# EasyEDA Pro project realtix-sakura_nfc-d968f2f9.epro, schematic Schematic4
Board Name: 执行器; Create Date: 2025-03-24; Page Name: P1; Project Name: 小樱nfc鸟头杖; Schematic Name: Schematic4; Update Date: 2025-03-24; Company: 嘉立创EDA; Page Size: A5; Version: V1.0
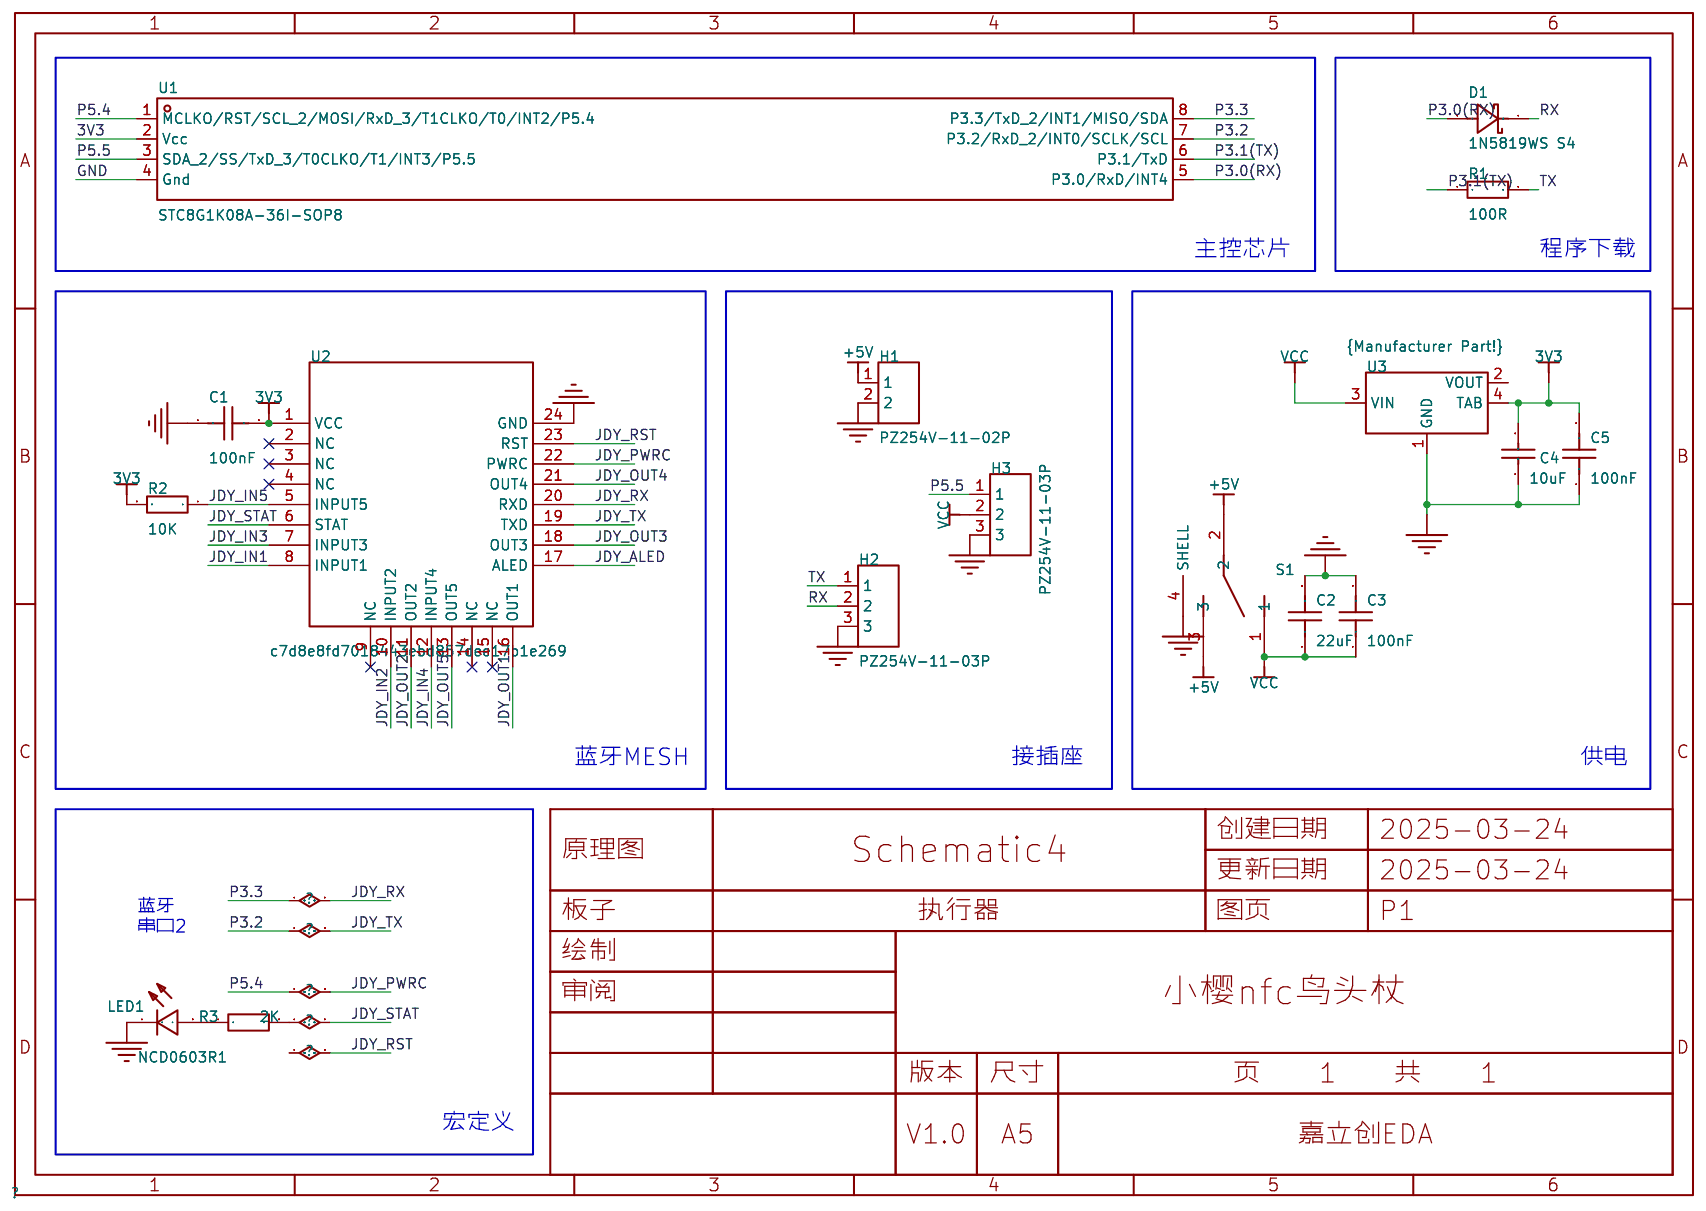
[diagram p3: schematic sheet]

## Parts
C1  100nF  [C0603]
C2  22uF  [C0805]
C3  100nF  [C0603]
C4  10uF  [C0805]
C5  100nF  [C0603]
D1  1N5819WS S4  [SOD-323_L1.6-W1.3-LS2.7-RD]
H1  PZ254V-11-02P  [HDR-TH_2P-P2.54-V-M]
H2  PZ254V-11-03P  [HDR-TH_3P-P2.54-V-M]
H3  PZ254V-11-03P  [HDR-TH_3P-P2.54-V-M]
LED1  NCD0603R1  [LED0603-RD_RED]
R1  100R  [R0603]
R2  10K  [R0603]
R3  2K  [R0603]
S1  -  [SW-SMD_PCM12SMTR]
U1  STC8G1K08A-36I-SOP8  [SOP-8_L5.0-W4.0-P1.27-LS6.0-BL]
U2  c7d8e8fd7018443ebd857dee17b1e269  [JDY-25M]
U3  -  [SOT_223]

## Library data of the parts
C1 C3 C5 = CAP_0603: Supplier Footprint: 0603
C2 = CL21A226MAQNNNE_C45783: 容值:22uF;精度:±20%;额定电压:25V;材质(温度系数):X5R;; LCSC Part Name: 22uF ±20% 25V; Supplier Part: C45783; Manufacturer: SAMSUNG(三星); Manufacturer Part: CL21A226MAQNNNE; Supplier Footprint: 0805; JLCPCB Part Class: Basic Part; Datasheet: https://atta.szlcsc.com/upload/public/pdf/source/20160103/1457707727161.pdf; Supplier: LCSC; Tolerance: ±20%; Voltage Rated: 25V; Temperature Coefficient: X5R
C4 = CL21A106KAYNNNE_C15850: 容值:10uF;精度:±10%;额定电压:25V;材质(温度系数):X5R;; LCSC Part Name: 10uF ±10% 25V; Supplier Part: C15850; Manufacturer: SAMSUNG(三星); Manufacturer Part: CL21A106KAYNNNE; Supplier Footprint: 0805; JLCPCB Part Class: Basic Part; Datasheet: https://atta.szlcsc.com/upload/public/pdf/source/20160103/1457707679302.pdf; Supplier: LCSC; Tolerance: ±10%; Voltage Rated: 25V; Temperature Coefficient: X5R
D1 = 1N5819WS S4_C2927280: 二极管配置:独立式;直流反向耐压(Vr):40V;平均整流电流(Io):350mA;正向压降(Vf):600mV@200mA;反向电流(Ir):5uA@30V;; LCSC Part Name: 40V 350mA 600mV@200mA; Supplier Part: C2927280; Manufacturer: JSMSEMI(杰盛微); Supplier Footprint: SOD-323; JLCPCB Part Class: 扩展库; Datasheet: https://atta.szlcsc.com/upload/public/pdf/source/20211230/020DF3ABCB41CBA5E28580D63AFB2CA3.pdf; Supplier: LCSC; Diode Configuration: 独立式; Reverse Voltage (Vr): 40V; Average Rectified Current (Io): 350mA; Forward Voltage (Vf@If): 600mV@200mA; Reverse Leakage Current (Ir): 5uA@30V
H1 = PZ254V-11-02P: 插针结构:1x2P;间距:2.54mm;行距:-;圆针/方针:方针;安装方式:直插;排数:单排;总PIN位数:2P;额定电流:-;额定电压:-;配合针长度:6mm;塑高:2.5mm;端接针长度:3mm;触头材质:黄铜;触头镀层:-;工作温度:-40℃~+105℃;颜色:黑色;; LCSC Part Name: 1x2P 间距:2.54mm 方针 直插; Supplier Part: C492401; Manufacturer: XFCN(兴飞); Supplier Footprint: 插件,P=2.54mm; JLCPCB Part Class: 扩展库; Datasheet: https://atta.szlcsc.com/upload/public/pdf/source/20200309/C492401_A812433581A9B211A7FFA413ADDFF0E5.pdf; Supplier: LCSC; Pin Structure: 1x2P; Pitch: 2.54mm; Circluar Pins/Square Pins: 方针; Mounting Type: 直插; Number of Rows: 单排; Number of Pins: 2P; Length of Mating Pin: 6mm; Insulation Height: 2.5mm; Length of End Connection Pin: 3mm; Contact Material: 黄铜; Operating Temperature: -40℃~+105℃; Color: 黑色
H2 H3 = PZ254V-11-03P: 插针结构:1x3P;间距:2.54mm;行距:-;圆针/方针:方针;安装方式:直插;排数:单排;总PIN位数:3P;额定电流:3A;额定电压:250V;配合针长度:6mm;塑高:2.5mm;端接针长度:3mm;工作温度:-40℃~+105℃;颜色:黑色;; LCSC Part Name: 1x3P 间距:2.54mm 方针 直插; Supplier Part: C2937625; Manufacturer: XFCN(兴飞); Supplier Footprint: 插件,P=2.54mm; JLCPCB Part Class: 扩展库; Datasheet: https://atta.szlcsc.com/upload/public/pdf/source/20200309/C492402_8335C3D49C4E4C618838D59BB1D024C1.pdf; Supplier: LCSC; Pin Structure: 1x3P; Pitch: 2.54mm; Circluar Pins/Square Pins: 方针; Mounting Type: 直插; Number of Rows: 单排; Number of Pins: 3P; Current Rating: 3A; Voltage Rating (Max): 250V; Length of Mating Pin: 6mm; Insulation Height: 2.5mm; Length of End Connection Pin: 3mm; Operating Temperature: -40℃~+105℃; Color: 黑色
LED1 = NCD0603R1_C84263: 灯头类型:-;发光颜色:红色;正向电压(VF):1.6V~2.6V;功率:65mW;正向电流:20mA;主波长:615nm~630nm;二极管配置:独立二极管;透镜颜色:无色透明透镜;色温:-;发光强度:80mcd~220mcd;发光角度:130°;载带方式:-;工作温度:-30℃~+85℃;; Supplier Part: C84263; Manufacturer: 国星光电; Supplier Footprint: 0603; JLCPCB Part Class: 扩展库; Datasheet: https://atta.szlcsc.com/upload/public/pdf/source/20200820/C84263_DABC6A75E58F576973B407FDBA283D60.pdf; Supplier: LCSC; Emitted Color: 红色; Forward Voltage (VF): 1.6V~2.6V; Power Dissipation: 65mW; Forward Current: 20mA; Dominant Wavelength: 615nm~630nm; Diode Configuration: 独立二极管; Lens Color: 无色透明透镜; Luminous Intensity: 80mcd~220mcd; Viewing Angle: 130°; Operating Temperature: -30℃~+85℃
R1-R3 = Res_0603: Supplier Footprint: 0603
S1 = 拨动开关ss12d: 两档三脚直插拨动开关 2023_2_10
U1 = STC8G1K08A-36I-SOP8: CPU内核:51系列;CPU最大主频:-;工作电压范围:1.9V~5.5V;内部振荡器:有;外部时钟频率范围:-;程序 FLASH容量:8KB;RAM总容量:1.25KB;EEPROM/数据 FLASH容量:4KB;GPIO端口数量:6;ADC(单元数/通道数/位数):1@x6ch/10bit;DAC(单元数/通道数/位数):-;(E)PWM(单元数/通道数/位数):-;8位Timer数量:-;16位Timer数量:2;32位Timer数量:-;内部比较器数量:-;U(S)ART路数:1;I2C路数:1;; LCSC Part Name: 51系列 闪存：8KB RAM：1.25KB; Supplier Part: C915663; Manufacturer: STC(宏晶); Supplier Footprint: SOP-8-4.0mm; JLCPCB Part Class: Extended Part; Datasheet: https://atta.szlcsc.com/upload/public/pdf/source/20201105/C713818_1666C7558605C197DBF08446D241F69F.pdf; Supplier: LCSC; CPU Core: 51系列; Supply Voltage Range: 1.9V~5.5V; Internal Oscillator: 有; Program FLASH Size: 8KB; RAM Size: 1.25KB; EEPROM/Data FLASH Size: 4KB; GPIO Ports Number: 6; ADC (Units/Channels/bits): 1@x6ch/10bit; 16Bit Timer Number: 2; U(S)ART Number: 1; I2C Number: 1; (Q)SPI Number: 1; Peripherals / Functions / Protocol Stacks: 低电压检测；看门狗；CCP捕获/比较；除法器；乘法器; Operating Temperature Range: -40℃~+85℃
U2 = JDY-25M: 蓝牙mesh组网模组
U3 = AMS1117

## Nets
3V3: C1.2 C4.2 C5.2 R2.2 U1.2(Vcc) U2.1(VCC) U3.4(TAB)
+5V: H1.1 S1.2 S1.3
GND: C1.1 C2.2 C3.2 C4.1 C5.1 H1.2 H2.3 H3.3 LED1.1(K) S1.4(SHELL) U1.4(Gnd) U2.24(GND) U3.1(GND)
VCC: C2.1 C3.1 H3.2 S1.1 U3.3(VIN)
JDY_ALED: U2.17(ALED)
JDY_IN1: U2.8(INPUT1)
JDY_IN2: U2.10(INPUT2)
JDY_IN3: U2.7(INPUT3)
JDY_IN4: U2.12(INPUT4)
JDY_IN5: R2.1 U2.5(INPUT5)
JDY_OUT1: U2.16(OUT1)
JDY_OUT2: U2.11(OUT2)
JDY_OUT3: U2.18(OUT3)
JDY_OUT4: U2.21(OUT4)
JDY_OUT5: U2.13(OUT5)
JDY_PWRC: U1.1(MCLKO/RST/SCL_2/MOSI/RxD_3/T1CLKO/T0/INT2/P5.4) U2.22(PWRC)
JDY_RST: U2.23(RST)
JDY_RX: U1.8(P3.3/TxD_2/INT1/MISO/SDA) U2.20(RXD)
JDY_STAT: R3.2 U2.6(STAT)
JDY_TX: U1.7(P3.2/RxD_2/INT0/SCLK/SCL) U2.19(TXD)
P3.0(RX): D1.2(A) U1.5(P3.0/RxD/INT4)
P3.1(TX): R1.1 U1.6(P3.1/TxD)
P5.5: H3.1 U1.3(SDA_2/SS/TxD_3/T0CLKO/T1/INT3/P5.5)
RX: D1.1(C) H2.2
TX: H2.1 R1.2
$1N2476: LED1.2(A) R3.1

Not connected (* = marked no-connect by the designer): U2 2(NC)* 3(NC)* 4(NC)* 9(NC)* 14(NC)* 15(NC)*; U3 2(VOUT)

## Notes on the sheet
- 主控芯片
- 程序下载
- 蓝牙MESH
- 接插座
- 供电
- 蓝牙
  串口2
- 宏定义
